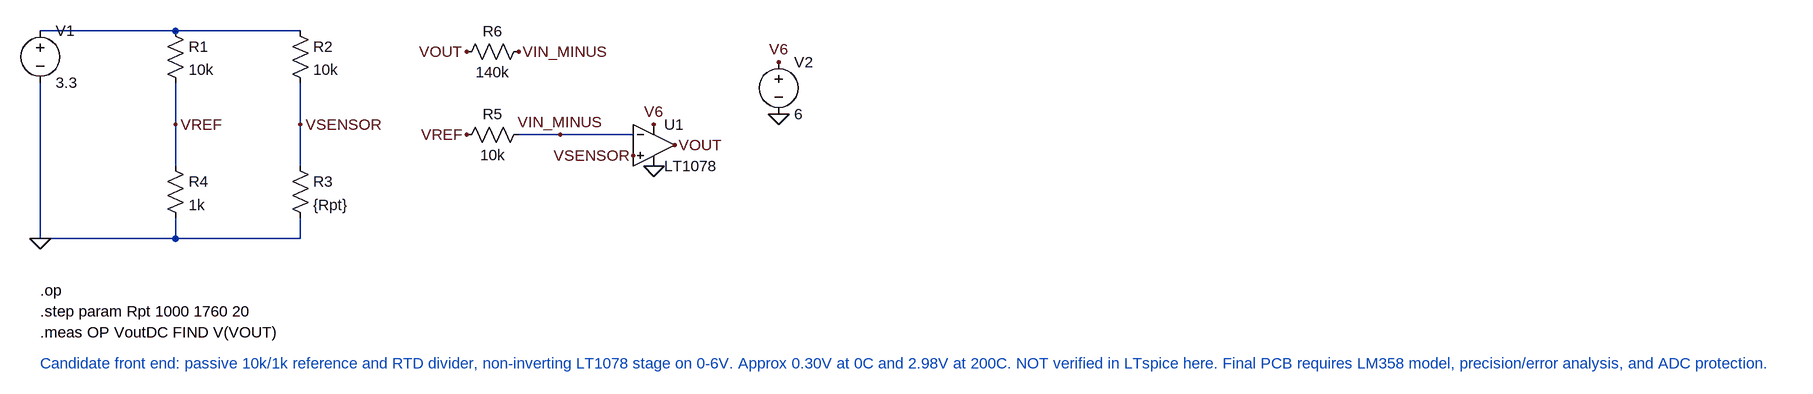
[diagram p0: schematic thermal_bridge_single_supply_LT1078.asc]
thermal_bridge_single_supply_LT1078.asc, the LTspice schematic file:
Version 4.1
SHEET 1 2892 704
WIRE 208 128 0 128
WIRE 400 128 208 128
WIRE 208 272 208 208
WIRE 400 272 400 208
WIRE 800 288 736 288
WIRE 912 288 800 288
WIRE 208 336 208 272
WIRE 400 336 400 272
WIRE 0 448 0 208
WIRE 208 448 208 416
WIRE 208 448 0 448
WIRE 400 448 400 416
WIRE 400 448 208 448
FLAG 0 448 0
FLAG 208 272 VREF
FLAG 400 272 VSENSOR
FLAG 656 288 VREF
FLAG 800 288 VIN_MINUS
FLAG 656 160 VOUT
FLAG 736 160 VIN_MINUS
FLAG 912 320 VSENSOR
FLAG 944 272 V6
FLAG 944 336 0
FLAG 976 304 VOUT
FLAG 1136 176 V6
FLAG 1136 256 0
SYMBOL voltage 0 112 R0
SYMATTR InstName V1
SYMATTR Value 3.3
SYMBOL res 192 112 R0
SYMATTR InstName R1
SYMATTR Value 10k
SYMBOL res 192 320 R0
SYMATTR InstName R4
SYMATTR Value 1k
SYMBOL res 384 112 R0
SYMATTR InstName R2
SYMATTR Value 10k
SYMBOL res 384 320 R0
SYMATTR InstName R3
SYMATTR Value {Rpt}
SYMBOL res 752 272 R90
WINDOW 0 0 56 VBottom 2
WINDOW 3 32 56 VTop 2
SYMATTR InstName R5
SYMATTR Value 10k
SYMBOL res 752 144 R90
WINDOW 0 0 56 VBottom 2
WINDOW 3 32 56 VTop 2
SYMATTR InstName R6
SYMATTR Value 140k
SYMBOL OpAmps\\LT1078 944 240 R0
SYMATTR InstName U1
SYMBOL voltage 1136 160 R0
SYMATTR InstName V2
SYMATTR Value 6
TEXT 0 528 Left 2 !.op
TEXT 0 560 Left 2 !.step param Rpt 1000 1760 20
TEXT 0 592 Left 2 !.meas OP VoutDC FIND V(VOUT)
TEXT 0 640 Left 2 ;Candidate front end: passive 10k/1k reference and RTD divider, non-inverting LT1078 stage on 0-6V. Approx 0.30V at 0C and 2.98V at 200C. NOT verified in LTspice here. Final PCB requires LM358 model, precision/error analysis, and ADC protection.

The netlist it stands for:
* thermal_bridge_single_supply_LT1078.asc
V1 N001 0 3.3
R1 N001 VREF 10k
R4 VREF 0 1k
R2 N001 VSENSOR 10k
R3 VSENSOR 0 {Rpt}
R5 VIN_MINUS VREF 10k
R6 VIN_MINUS VOUT 140k
X§U1 VSENSOR VIN_MINUS V6 0 VOUT LT1078  ; pins In+ In- V+ V- OUT
V2 V6 0 6
.op
.step param Rpt 1000 1760 20
.meas OP VoutDC FIND V(VOUT)
* Candidate front end: passive 10k/1k reference and RTD divider, non-inverting LT1078 stage on 0-6V. Approx 0.30V at 0C and 2.98V at 200C. NOT verified in LTspice here. Final PCB requires LM358 model, precision/error analysis, and ADC protection.
.backanno
.end

* Results of the author's LTspice run, read from the files saved beside the schematic
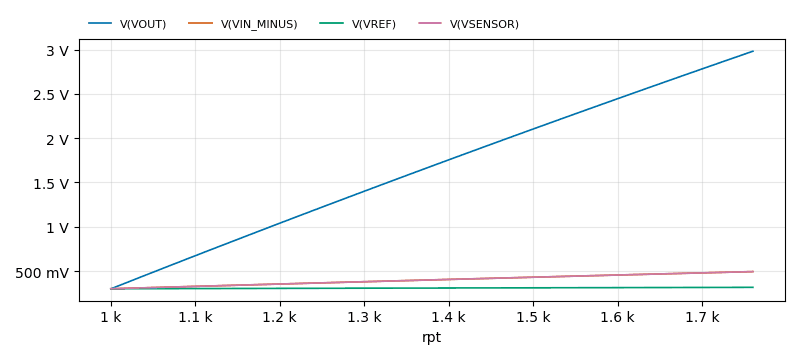
[diagram p1: Operating Point of thermal_bridge_single_supply_LT1078.asc, plotted from the saved traces]
* Operating Point, 1 run:
*   V(VOUT): 299.2 mV at rpt=1 k, 2.981 V at rpt=1.76 k, min 299.2 mV, max 2.981 V
*   V(VIN_MINUS): 300 mV at rpt=1 k, 493.9 mV at rpt=1.76 k, min 300 mV, max 493.9 mV
*   V(VREF): 300 mV at rpt=1 k, 316.2 mV at rpt=1.76 k, min 300 mV, max 316.2 mV
*   V(VSENSOR): 300 mV at rpt=1 k, 493.9 mV at rpt=1.76 k, min 300 mV, max 493.9 mV
* From the log:
*   voutdc: V(VOUT)=0.299242049456 at 1000